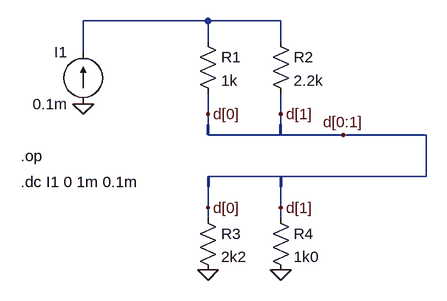
[diagram p0: schematic bus_connectors.asc]
bus_connectors.asc, the LTspice schematic file:
Version 4.1
SHEET 1 880 680
WIRE 288 80 96 80
WIRE 400 80 288 80
WIRE 288 112 288 80
WIRE 400 112 400 80
WIRE 96 128 96 80
WIRE 288 224 288 192
WIRE 400 224 400 192
WIRE 288 240 288 224
WIRE 400 240 400 224
WIRE 400 256 288 256
WIRE 496 256 400 256
WIRE 624 256 496 256
WIRE 400 320 288 320
WIRE 624 320 624 256
WIRE 624 320 400 320
WIRE 288 368 288 336
WIRE 400 368 400 336
WIRE 288 384 288 368
WIRE 400 384 400 368
FLAG 288 224 d[0]
FLAG 400 224 d[1]
FLAG 400 368 d[1]
FLAG 288 368 d[0]
FLAG 288 464 0
FLAG 400 464 0
FLAG 96 208 0
FLAG 496 256 d[0:1]
BUSTAP 288 256 288 240
BUSTAP 400 256 400 240
BUSTAP 288 320 288 336
BUSTAP 400 320 400 336
SYMBOL res 272 96 R0
SYMATTR InstName R1
SYMATTR Value 1k
SYMBOL res 384 96 R0
SYMATTR InstName R2
SYMATTR Value 2.2k
SYMBOL res 272 368 R0
SYMATTR InstName R3
SYMATTR Value 2k2
SYMBOL res 384 368 R0
SYMATTR InstName R4
SYMATTR Value 1k0
SYMBOL current 96 208 R180
WINDOW 0 24 80 Left 2
WINDOW 3 24 0 Left 2
WINDOW 123 0 0 Left 0
WINDOW 39 0 0 Left 0
SYMATTR InstName I1
SYMATTR Value 0.1m
TEXT 0 288 Left 2 !.op
TEXT 0 328 Left 2 !.dc I1 0 1m 0.1m

The netlist it stands for:
* bus_connectors.asc
R1 N001 d[0] 1k
R2 N001 d[1] 2.2k
R3 d[0] 0 2k2
R4 d[1] 0 1k0
I1 0 N001 0.1m
.op
.dc I1 0 1m 0.1m
.backanno
.end